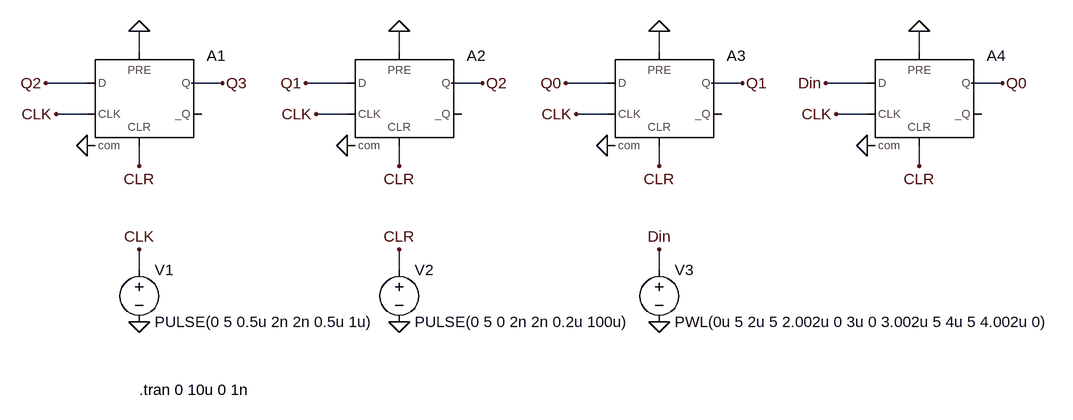
[diagram p0: schematic shift_left_register.asc]
shift_left_register.asc, the LTspice schematic file:
Version 4
SHEET 1 1872 768
WIRE -144 48 -80 48
WIRE -128 96 -80 96
WIRE 0 176 0 144
WIRE 0 -32 0 0
WIRE 128 48 80 48
WIRE 256 48 320 48
WIRE 272 96 320 96
WIRE 400 176 400 144
WIRE 400 -32 400 0
WIRE 528 48 480 48
WIRE 656 48 720 48
WIRE 672 96 720 96
WIRE 800 176 800 144
WIRE 800 -32 800 0
WIRE 928 48 880 48
WIRE 1056 48 1120 48
WIRE 1072 96 1120 96
WIRE 1200 176 1200 144
WIRE 1200 -32 1200 0
WIRE 1328 48 1280 48
WIRE 0 304 0 336
WIRE 400 304 400 336
WIRE 800 304 800 336
FLAG -144 48 Q2
FLAG -128 96 CLK
FLAG 0 176 CLR
FLAG 0 -32 0
FLAG -80 144 0
FLAG 128 48 Q3
FLAG 256 48 Q1
FLAG 272 96 CLK
FLAG 400 176 CLR
FLAG 400 -32 0
FLAG 320 144 0
FLAG 528 48 Q2
FLAG 656 48 Q0
FLAG 672 96 CLK
FLAG 800 176 CLR
FLAG 800 -32 0
FLAG 720 144 0
FLAG 928 48 Q1
FLAG 1056 48 Din
FLAG 1072 96 CLK
FLAG 1200 176 CLR
FLAG 1200 -32 0
FLAG 1120 144 0
FLAG 1328 48 Q0
FLAG 0 304 CLK
FLAG 0 416 0
FLAG 400 304 CLR
FLAG 400 416 0
FLAG 800 304 Din
FLAG 800 416 0
SYMBOL Digital\\dflop 0 0 R0
SYMATTR InstName A1
SYMATTR SpiceLine Vhigh=5 Vlow=0 Ref=2.5 Td=10n
SYMBOL Digital\\dflop 400 0 R0
SYMATTR InstName A2
SYMATTR SpiceLine Vhigh=5 Vlow=0 Ref=2.5 Td=10n
SYMBOL Digital\\dflop 800 0 R0
SYMATTR InstName A3
SYMATTR SpiceLine Vhigh=5 Vlow=0 Ref=2.5 Td=10n
SYMBOL Digital\\dflop 1200 0 R0
SYMATTR InstName A4
SYMATTR SpiceLine Vhigh=5 Vlow=0 Ref=2.5 Td=10n
SYMBOL voltage 0 320 R0
SYMATTR InstName V1
SYMATTR Value PULSE(0 5 0.5u 2n 2n 0.5u 1u)
SYMBOL voltage 400 320 R0
SYMATTR InstName V2
SYMATTR Value PULSE(0 5 0 2n 2n 0.2u 100u)
SYMBOL voltage 800 320 R0
SYMATTR InstName V3
SYMATTR Value PWL(0u 5 2u 5 2.002u 0 3u 0 3.002u 5 4u 5 4.002u 0)
TEXT 0 520 Left 2 !.tran 0 10u 0 1n

The netlist it stands for:
* shift_left_register.asc
A1 Q2 0 CLK 0 CLR 0 Q3 0 DFLOP Vhigh=5 Vlow=0 Ref=2.5 Td=10n
A2 Q1 0 CLK 0 CLR 0 Q2 0 DFLOP Vhigh=5 Vlow=0 Ref=2.5 Td=10n
A3 Q0 0 CLK 0 CLR 0 Q1 0 DFLOP Vhigh=5 Vlow=0 Ref=2.5 Td=10n
A4 Din 0 CLK 0 CLR 0 Q0 0 DFLOP Vhigh=5 Vlow=0 Ref=2.5 Td=10n
V1 CLK 0 PULSE(0 5 0.5u 2n 2n 0.5u 1u)
V2 CLR 0 PULSE(0 5 0 2n 2n 0.2u 100u)
V3 Din 0 PWL(0u 5 2u 5 2.002u 0 3u 0 3.002u 5 4u 5 4.002u 0)
.tran 0 10u 0 1n
.backanno
.end